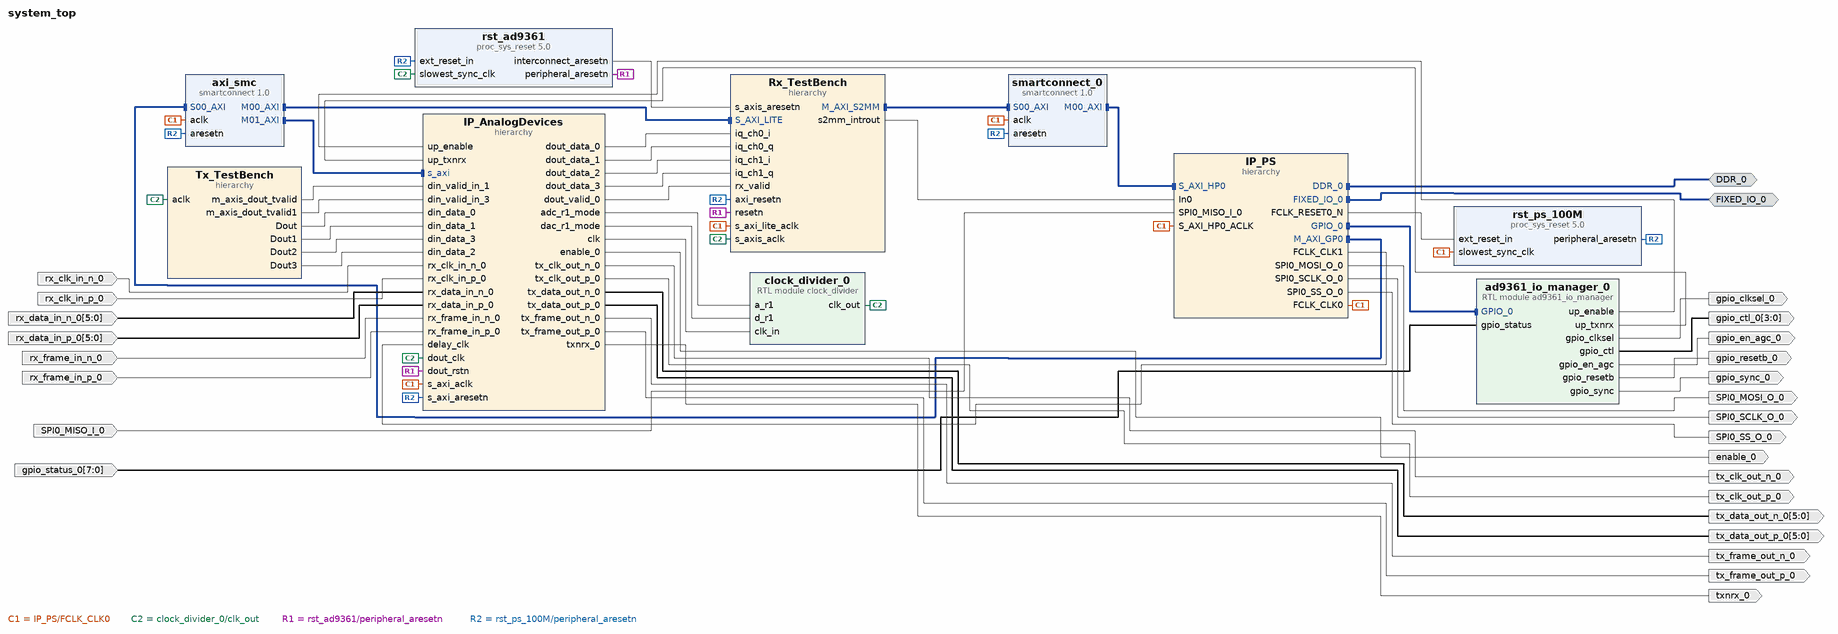
[diagram p0: block diagram of the top level]
# Vivado block design system_top, xc7z035ifbg676-2L, Vivado 2022.2
create_bd_design system_top

create_bd_intf_port -mode Master -vlnv xilinx.com:interface:ddrx_rtl:1.0 DDR_0
create_bd_intf_port -mode Master -vlnv xilinx.com:display_processing_system7:fixedio_rtl:1.0 FIXED_IO_0
create_bd_port -dir I SPI0_MISO_I_0
create_bd_port -dir O SPI0_MOSI_O_0
create_bd_port -dir O SPI0_SCLK_O_0
create_bd_port -dir O SPI0_SS_O_0
create_bd_port -dir O enable_0
create_bd_port -dir O gpio_clksel_0
create_bd_port -dir O -from 3 -to 0 gpio_ctl_0
create_bd_port -dir O gpio_en_agc_0
create_bd_port -dir O gpio_resetb_0
create_bd_port -dir I -from 7 -to 0 gpio_status_0
create_bd_port -dir O gpio_sync_0
create_bd_port -dir I rx_clk_in_n_0
create_bd_port -dir I rx_clk_in_p_0
create_bd_port -dir I -from 5 -to 0 rx_data_in_n_0
create_bd_port -dir I -from 5 -to 0 rx_data_in_p_0
create_bd_port -dir I rx_frame_in_n_0
create_bd_port -dir I rx_frame_in_p_0
create_bd_port -dir O tx_clk_out_n_0
create_bd_port -dir O tx_clk_out_p_0
create_bd_port -dir O -from 5 -to 0 tx_data_out_n_0
create_bd_port -dir O -from 5 -to 0 tx_data_out_p_0
create_bd_port -dir O tx_frame_out_n_0
create_bd_port -dir O tx_frame_out_p_0
create_bd_port -dir O txnrx_0

create_bd_cell -type hier IP_AnalogDevices
create_bd_cell -type hier IP_PS
create_bd_cell -type hier Rx_TestBench
create_bd_cell -type hier Tx_TestBench
create_bd_cell -type module -reference ad9361_io_manager ad9361_io_manager_0
create_bd_cell -type ip -vlnv xilinx.com:ip:smartconnect:1.0 axi_smc
set_property -dict {CONFIG.NUM_MI 2 CONFIG.NUM_SI 1} [get_bd_cells axi_smc]
create_bd_cell -type module -reference clock_divider clock_divider_0
create_bd_cell -type ip -vlnv xilinx.com:ip:proc_sys_reset:5.0 rst_ad9361
create_bd_cell -type ip -vlnv xilinx.com:ip:proc_sys_reset:5.0 rst_ps_100M
create_bd_cell -type ip -vlnv xilinx.com:ip:smartconnect:1.0 smartconnect_0
set_property -dict {CONFIG.NUM_CLKS 1 CONFIG.NUM_SI 1} [get_bd_cells smartconnect_0]

# ---- hierarchy /IP_AnalogDevices ----
current_bd_instance /IP_AnalogDevices
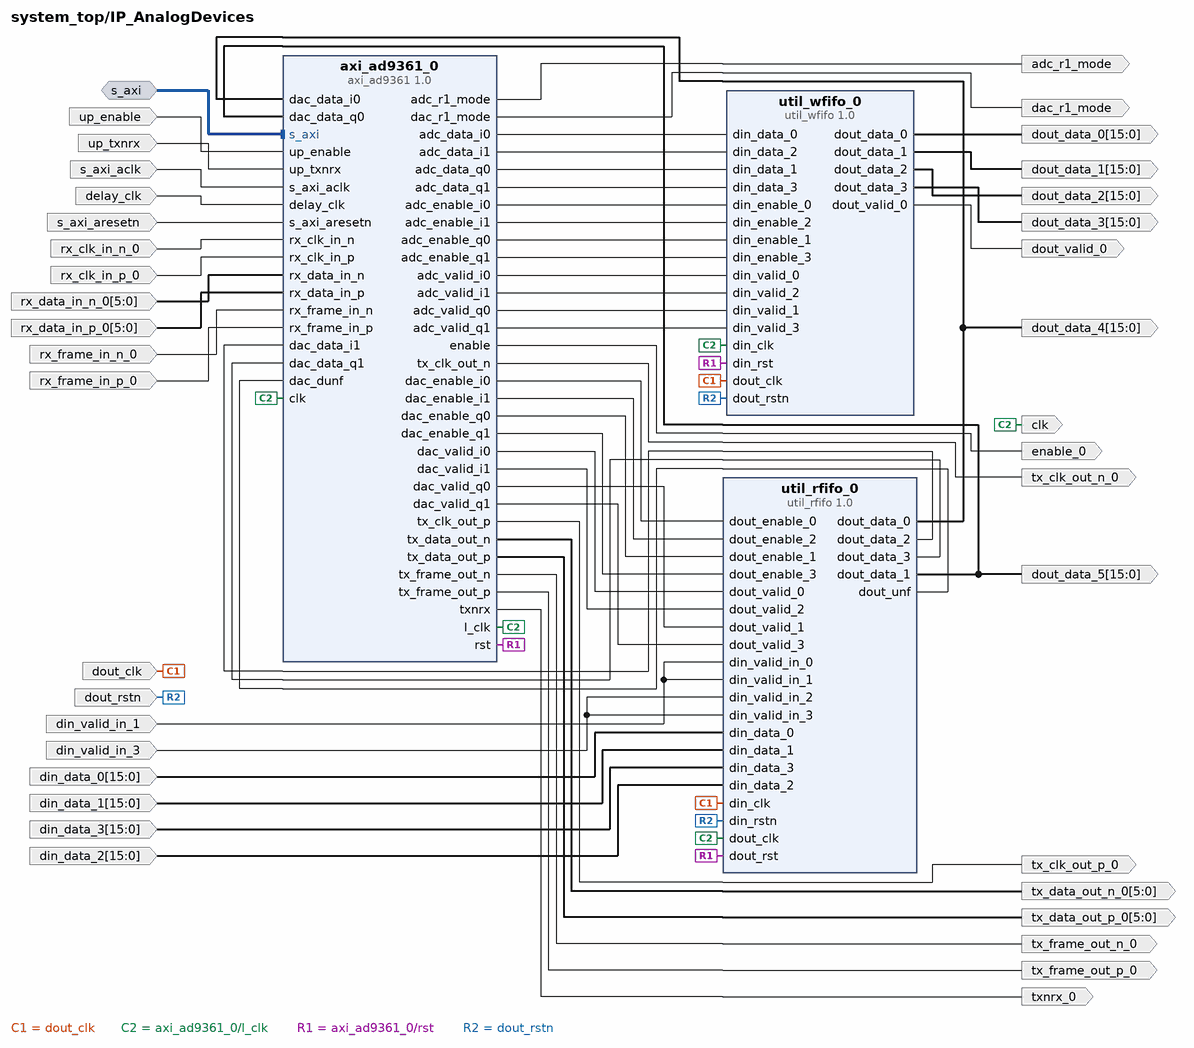
[diagram p1: block diagram inside /IP_AnalogDevices]
create_bd_intf_pin -mode Slave -vlnv xilinx.com:interface:aximm_rtl:1.0 s_axi
create_bd_pin -dir O adc_r1_mode
create_bd_pin -dir O -type clk clk
create_bd_pin -dir O dac_r1_mode
create_bd_pin -dir I -type clk delay_clk
create_bd_pin -dir I -from 15 -to 0 din_data_0
create_bd_pin -dir I -from 15 -to 0 din_data_1
create_bd_pin -dir I -from 15 -to 0 din_data_2
create_bd_pin -dir I -from 15 -to 0 din_data_3
create_bd_pin -dir I din_valid_in_1
create_bd_pin -dir I din_valid_in_3
create_bd_pin -dir I -type clk dout_clk
create_bd_pin -dir O -from 15 -to 0 dout_data_0
create_bd_pin -dir O -from 15 -to 0 dout_data_1
create_bd_pin -dir O -from 15 -to 0 dout_data_2
create_bd_pin -dir O -from 15 -to 0 dout_data_3
create_bd_pin -dir O -from 15 -to 0 dout_data_4
create_bd_pin -dir O -from 15 -to 0 dout_data_5
create_bd_pin -dir I -type rst dout_rstn
create_bd_pin -dir O dout_valid_0
create_bd_pin -dir O enable_0
create_bd_pin -dir I rx_clk_in_n_0
create_bd_pin -dir I rx_clk_in_p_0
create_bd_pin -dir I -from 5 -to 0 rx_data_in_n_0
create_bd_pin -dir I -from 5 -to 0 rx_data_in_p_0
create_bd_pin -dir I rx_frame_in_n_0
create_bd_pin -dir I rx_frame_in_p_0
create_bd_pin -dir I -type clk s_axi_aclk
create_bd_pin -dir I -type rst s_axi_aresetn
create_bd_pin -dir O tx_clk_out_n_0
create_bd_pin -dir O tx_clk_out_p_0
create_bd_pin -dir O -from 5 -to 0 tx_data_out_n_0
create_bd_pin -dir O -from 5 -to 0 tx_data_out_p_0
create_bd_pin -dir O tx_frame_out_n_0
create_bd_pin -dir O tx_frame_out_p_0
create_bd_pin -dir O txnrx_0
create_bd_pin -dir I up_enable
create_bd_pin -dir I up_txnrx

create_bd_cell -type ip -vlnv analog.com:user:axi_ad9361:1.0 axi_ad9361_0
set_property -dict [list \
  CONFIG.ADC_INIT_DELAY 29 \
  CONFIG.DAC_IODELAY_ENABLE 1 \
  CONFIG.DELAY_REFCLK_FREQUENCY 200 \
  CONFIG.TDD_DISABLE 1 \
] [get_bd_cells axi_ad9361_0]
create_bd_cell -type ip -vlnv analog.com:user:util_rfifo:1.0 util_rfifo_0
set_property -dict {CONFIG.DIN_DATA_WIDTH 16 CONFIG.DOUT_DATA_WIDTH 16} [get_bd_cells util_rfifo_0]
create_bd_cell -type ip -vlnv analog.com:user:util_wfifo:1.0 util_wfifo_0
set_property -dict {CONFIG.DIN_DATA_WIDTH 16 CONFIG.DOUT_DATA_WIDTH 16} [get_bd_cells util_wfifo_0]

# ---- hierarchy /IP_PS ----
current_bd_instance /IP_PS
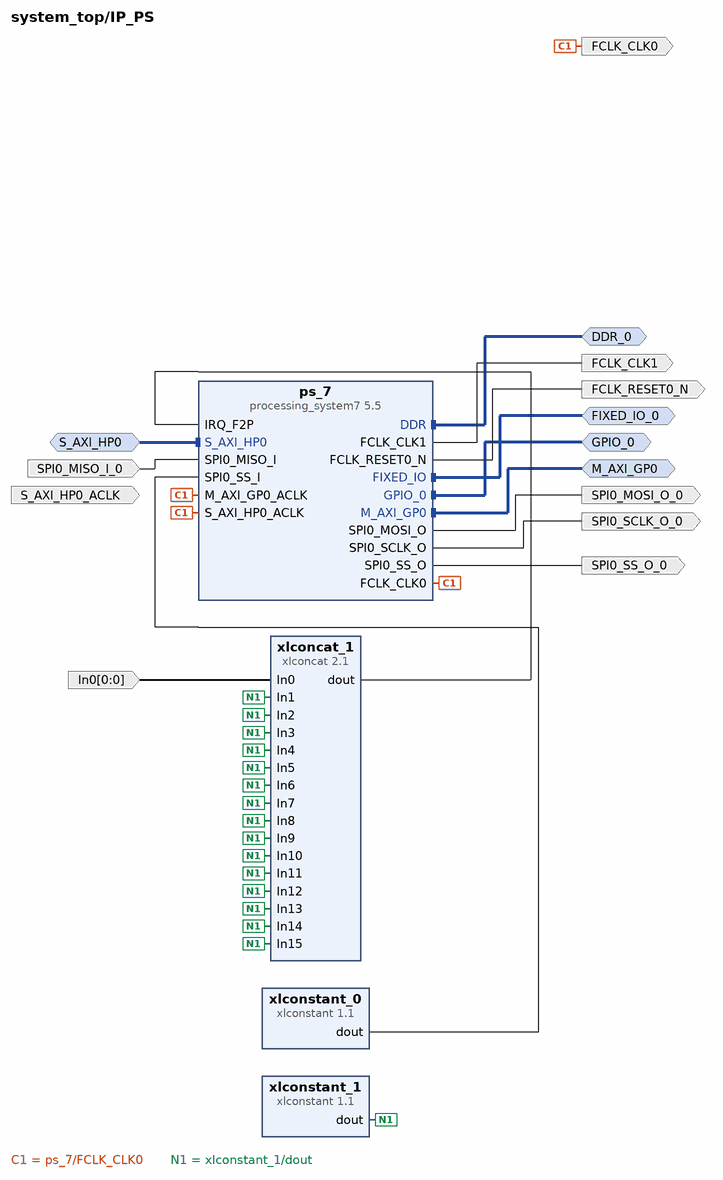
[diagram p2: block diagram inside /IP_PS]
create_bd_intf_pin -mode Master -vlnv xilinx.com:interface:ddrx_rtl:1.0 DDR_0
create_bd_intf_pin -mode Master -vlnv xilinx.com:display_processing_system7:fixedio_rtl:1.0 FIXED_IO_0
create_bd_intf_pin -mode Master -vlnv xilinx.com:interface:gpio_rtl:1.0 GPIO_0
create_bd_intf_pin -mode Master -vlnv xilinx.com:interface:aximm_rtl:1.0 M_AXI_GP0
create_bd_intf_pin -mode Slave -vlnv xilinx.com:interface:aximm_rtl:1.0 S_AXI_HP0
create_bd_pin -dir O -type clk FCLK_CLK0
create_bd_pin -dir O -type clk FCLK_CLK1
create_bd_pin -dir O -type rst FCLK_RESET0_N
create_bd_pin -dir I -from 0 -to 0 In0
create_bd_pin -dir I SPI0_MISO_I_0
create_bd_pin -dir O SPI0_MOSI_O_0
create_bd_pin -dir O SPI0_SCLK_O_0
create_bd_pin -dir O SPI0_SS_O_0
create_bd_pin -dir I -type clk S_AXI_HP0_ACLK

create_bd_cell -type ip -vlnv xilinx.com:ip:processing_system7:5.5 ps_7
set_property -dict [list \
  CONFIG.PCW_APU_PERIPHERAL_FREQMHZ 666.666666 \
  CONFIG.PCW_CPU_CPU_6X4X_MAX_RANGE 800 \
  CONFIG.PCW_ENET0_ENET0_IO {MIO 16 .. 27} \
  CONFIG.PCW_ENET0_GRP_MDIO_ENABLE 1 \
  CONFIG.PCW_ENET0_GRP_MDIO_IO {MIO 52 .. 53} \
  CONFIG.PCW_ENET0_PERIPHERAL_ENABLE 1 \
  CONFIG.PCW_ENET0_RESET_ENABLE 1 \
  CONFIG.PCW_ENET0_RESET_IO {MIO 8} \
  CONFIG.PCW_ENET_RESET_ENABLE 1 \
  CONFIG.PCW_ENET_RESET_SELECT {Share reset pin} \
  CONFIG.PCW_EN_CLK1_PORT 1 \
  CONFIG.PCW_FCLK_CLK0_BUF FALSE \
  CONFIG.PCW_FCLK_CLK1_BUF TRUE \
  CONFIG.PCW_FPGA0_PERIPHERAL_FREQMHZ 100 \
  CONFIG.PCW_FPGA1_PERIPHERAL_FREQMHZ 200 \
  CONFIG.PCW_FPGA_FCLK1_ENABLE 1 \
  CONFIG.PCW_GPIO_EMIO_GPIO_ENABLE 1 \
  CONFIG.PCW_GPIO_EMIO_GPIO_IO 64 \
  CONFIG.PCW_GPIO_MIO_GPIO_ENABLE 1 \
  CONFIG.PCW_GPIO_MIO_GPIO_IO MIO \
  CONFIG.PCW_I2C_RESET_ENABLE 0 \
  CONFIG.PCW_IRQ_F2P_INTR 1 \
  CONFIG.PCW_PERIPHERAL_BOARD_PRESET None \
  CONFIG.PCW_PRESET_BANK0_VOLTAGE {LVCMOS 1.8V} \
  CONFIG.PCW_PRESET_BANK1_VOLTAGE {LVCMOS 1.8V} \
  CONFIG.PCW_QSPI_GRP_SINGLE_SS_ENABLE 1 \
  CONFIG.PCW_QSPI_GRP_SINGLE_SS_IO {MIO 1 .. 6} \
  CONFIG.PCW_QSPI_PERIPHERAL_ENABLE 1 \
  CONFIG.PCW_QSPI_QSPI_IO {MIO 1 .. 6} \
  CONFIG.PCW_SD0_GRP_CD_ENABLE 0 \
  CONFIG.PCW_SD0_GRP_POW_ENABLE 1 \
  CONFIG.PCW_SD0_GRP_POW_IO {MIO 0} \
  CONFIG.PCW_SD0_GRP_WP_ENABLE 1 \
  CONFIG.PCW_SD0_GRP_WP_IO {MIO 50} \
  CONFIG.PCW_SD0_PERIPHERAL_ENABLE 1 \
  CONFIG.PCW_SD0_SD0_IO {MIO 40 .. 45} \
  CONFIG.PCW_SDIO_PERIPHERAL_FREQMHZ 100 \
  CONFIG.PCW_SINGLE_QSPI_DATA_MODE x4 \
  CONFIG.PCW_SPI0_PERIPHERAL_ENABLE 1 \
  CONFIG.PCW_SPI0_SPI0_IO EMIO \
  CONFIG.PCW_UART1_PERIPHERAL_ENABLE 1 \
  CONFIG.PCW_UART1_UART1_IO {MIO 48 .. 49} \
  CONFIG.PCW_UART_PERIPHERAL_FREQMHZ 100 \
  CONFIG.PCW_UIPARAM_DDR_FREQ_MHZ 533.333333 \
  CONFIG.PCW_UIPARAM_DDR_PARTNO {MT41K256M16 RE-125} \
  CONFIG.PCW_USB0_PERIPHERAL_ENABLE 0 \
  CONFIG.PCW_USB_RESET_ENABLE 0 \
  CONFIG.PCW_USE_FABRIC_INTERRUPT 1 \
  CONFIG.PCW_USE_S_AXI_HP0 1 \
] [get_bd_cells ps_7]
# 506 more settings of ps_7 are not shown: defaults, MIO pin electricals, DDR timing, and values the tool derives
create_bd_cell -type ip -vlnv xilinx.com:ip:xlconcat:2.1 xlconcat_1
set_property -dict {CONFIG.IN0_WIDTH 1 CONFIG.NUM_PORTS 16} [get_bd_cells xlconcat_1]
create_bd_cell -type ip -vlnv xilinx.com:ip:xlconstant:1.1 xlconstant_0
create_bd_cell -type ip -vlnv xilinx.com:ip:xlconstant:1.1 xlconstant_1
set_property -dict {CONFIG.CONST_VAL 0} [get_bd_cells xlconstant_1]

# ---- hierarchy /Rx_TestBench ----
current_bd_instance /Rx_TestBench
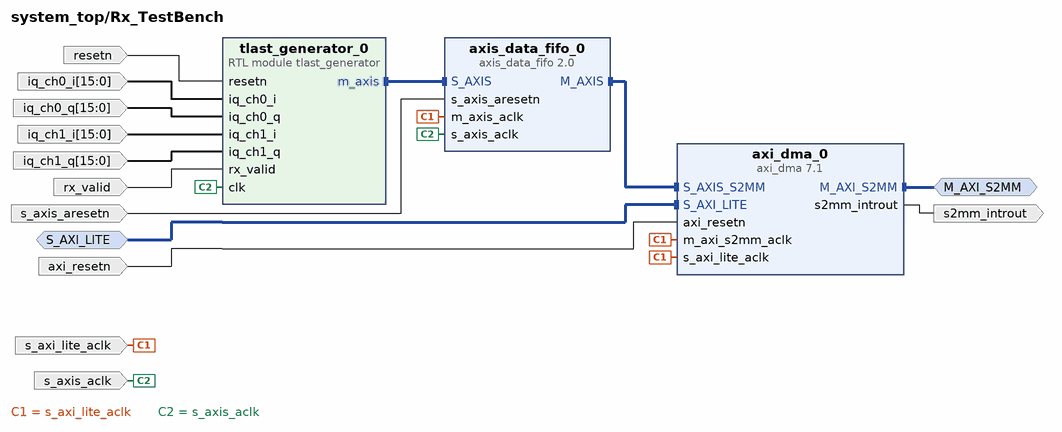
[diagram p3: block diagram inside /Rx_TestBench]
create_bd_intf_pin -mode Master -vlnv xilinx.com:interface:aximm_rtl:1.0 M_AXI_S2MM
create_bd_intf_pin -mode Slave -vlnv xilinx.com:interface:aximm_rtl:1.0 S_AXI_LITE
create_bd_pin -dir I -type rst axi_resetn
create_bd_pin -dir I -from 15 -to 0 iq_ch0_i
create_bd_pin -dir I -from 15 -to 0 iq_ch0_q
create_bd_pin -dir I -from 15 -to 0 iq_ch1_i
create_bd_pin -dir I -from 15 -to 0 iq_ch1_q
create_bd_pin -dir I -type rst resetn
create_bd_pin -dir I rx_valid
create_bd_pin -dir O -type intr s2mm_introut
create_bd_pin -dir I -type clk s_axi_lite_aclk
create_bd_pin -dir I -type clk s_axis_aclk
create_bd_pin -dir I -type rst s_axis_aresetn

create_bd_cell -type ip -vlnv xilinx.com:ip:axi_dma:7.1 axi_dma_0
set_property -dict [list \
  CONFIG.c_include_mm2s 0 \
  CONFIG.c_include_s2mm_dre 0 \
  CONFIG.c_include_sg 0 \
  CONFIG.c_s2mm_burst_size 64 \
] [get_bd_cells axi_dma_0]
create_bd_cell -type ip -vlnv xilinx.com:ip:axis_data_fifo:2.0 axis_data_fifo_0
set_property -dict {CONFIG.FIFO_DEPTH 1024 CONFIG.IS_ACLK_ASYNC 1} [get_bd_cells axis_data_fifo_0]
create_bd_cell -type module -reference tlast_generator tlast_generator_0
set_property -dict {CONFIG.PACKET_LENGTH 1024} [get_bd_cells tlast_generator_0]

# ---- hierarchy /Tx_TestBench ----
current_bd_instance /Tx_TestBench
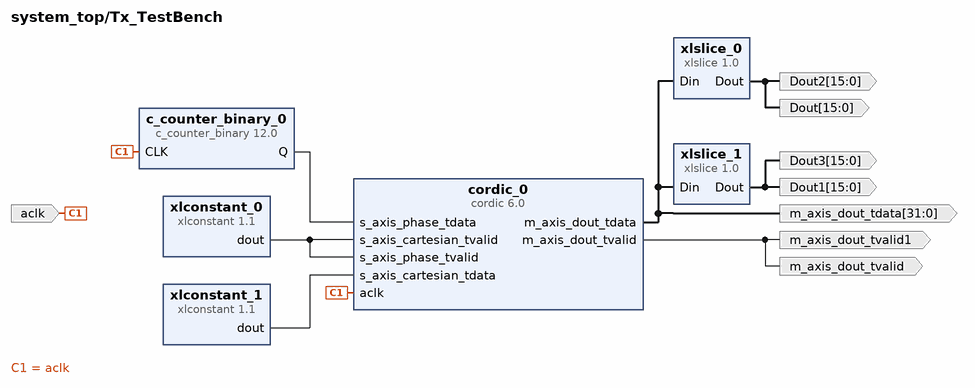
[diagram p4: block diagram inside /Tx_TestBench]
create_bd_pin -dir O -from 15 -to 0 Dout
create_bd_pin -dir O -from 15 -to 0 Dout1
create_bd_pin -dir O -from 15 -to 0 Dout2
create_bd_pin -dir O -from 15 -to 0 Dout3
create_bd_pin -dir I -type clk aclk
create_bd_pin -dir O -from 31 -to 0 m_axis_dout_tdata
create_bd_pin -dir O m_axis_dout_tvalid
create_bd_pin -dir O m_axis_dout_tvalid1

create_bd_cell -type ip -vlnv xilinx.com:ip:c_counter_binary:12.0 c_counter_binary_0
set_property -dict {CONFIG.Increment_Value 128 CONFIG.Restrict_Count false} [get_bd_cells c_counter_binary_0]
create_bd_cell -type ip -vlnv xilinx.com:ip:cordic:6.0 cordic_0
set_property -dict [list \
  CONFIG.Compensation_Scaling No_Scale_Compensation \
  CONFIG.Data_Format SignedFraction \
  CONFIG.Functional_Selection Rotate \
  CONFIG.Input_Width 16 \
  CONFIG.Output_Width 16 \
  CONFIG.cartesian_has_tlast false \
  CONFIG.out_tlast_behv Null \
] [get_bd_cells cordic_0]
create_bd_cell -type ip -vlnv xilinx.com:ip:xlconstant:1.1 xlconstant_0
create_bd_cell -type ip -vlnv xilinx.com:ip:xlconstant:1.1 xlconstant_1
set_property -dict {CONFIG.CONST_VAL 4095 CONFIG.CONST_WIDTH 32} [get_bd_cells xlconstant_1]
create_bd_cell -type ip -vlnv xilinx.com:ip:xlslice:1.0 xlslice_0
set_property -dict {CONFIG.DIN_FROM 15 CONFIG.DOUT_WIDTH 16} [get_bd_cells xlslice_0]
create_bd_cell -type ip -vlnv xilinx.com:ip:xlslice:1.0 xlslice_1
set_property -dict {CONFIG.DIN_FROM 31 CONFIG.DIN_TO 16} [get_bd_cells xlslice_1]

# ---- connections ----

current_bd_instance /IP_AnalogDevices
connect_bd_intf_net -intf_net axi_smc_M01_AXI [get_bd_intf_pins s_axi] [get_bd_intf_pins axi_ad9361_0/s_axi]
connect_bd_net [get_bd_pins dout_clk] [get_bd_pins util_rfifo_0/din_clk] [get_bd_pins util_wfifo_0/dout_clk]
connect_bd_net -net ad9361_io_manager_0_up_enable [get_bd_pins up_enable] [get_bd_pins axi_ad9361_0/up_enable]
connect_bd_net -net ad9361_io_manager_0_up_txnrx [get_bd_pins up_txnrx] [get_bd_pins axi_ad9361_0/up_txnrx]
connect_bd_net [get_bd_pins axi_ad9361_0/adc_data_i0] [get_bd_pins util_wfifo_0/din_data_0]
connect_bd_net [get_bd_pins axi_ad9361_0/adc_data_i1] [get_bd_pins util_wfifo_0/din_data_2]
connect_bd_net [get_bd_pins axi_ad9361_0/adc_data_q0] [get_bd_pins util_wfifo_0/din_data_1]
connect_bd_net [get_bd_pins axi_ad9361_0/adc_data_q1] [get_bd_pins util_wfifo_0/din_data_3]
connect_bd_net [get_bd_pins axi_ad9361_0/adc_enable_i0] [get_bd_pins util_wfifo_0/din_enable_0]
connect_bd_net [get_bd_pins axi_ad9361_0/adc_enable_i1] [get_bd_pins util_wfifo_0/din_enable_2]
connect_bd_net [get_bd_pins axi_ad9361_0/adc_enable_q0] [get_bd_pins util_wfifo_0/din_enable_1]
connect_bd_net [get_bd_pins axi_ad9361_0/adc_enable_q1] [get_bd_pins util_wfifo_0/din_enable_3]
connect_bd_net [get_bd_pins axi_ad9361_0/adc_r1_mode] [get_bd_pins adc_r1_mode]
connect_bd_net [get_bd_pins axi_ad9361_0/adc_valid_i0] [get_bd_pins util_wfifo_0/din_valid_0]
connect_bd_net [get_bd_pins axi_ad9361_0/adc_valid_i1] [get_bd_pins util_wfifo_0/din_valid_2]
connect_bd_net [get_bd_pins axi_ad9361_0/adc_valid_q0] [get_bd_pins util_wfifo_0/din_valid_1]
connect_bd_net [get_bd_pins axi_ad9361_0/adc_valid_q1] [get_bd_pins util_wfifo_0/din_valid_3]
connect_bd_net [get_bd_pins axi_ad9361_0/dac_enable_i0] [get_bd_pins util_rfifo_0/dout_enable_0]
connect_bd_net [get_bd_pins axi_ad9361_0/dac_enable_i1] [get_bd_pins util_rfifo_0/dout_enable_2]
connect_bd_net [get_bd_pins axi_ad9361_0/dac_enable_q0] [get_bd_pins util_rfifo_0/dout_enable_1]
connect_bd_net [get_bd_pins axi_ad9361_0/dac_enable_q1] [get_bd_pins util_rfifo_0/dout_enable_3]
connect_bd_net [get_bd_pins axi_ad9361_0/dac_r1_mode] [get_bd_pins dac_r1_mode]
connect_bd_net [get_bd_pins axi_ad9361_0/dac_valid_i0] [get_bd_pins util_rfifo_0/dout_valid_0]
connect_bd_net [get_bd_pins axi_ad9361_0/dac_valid_i1] [get_bd_pins util_rfifo_0/dout_valid_2]
connect_bd_net [get_bd_pins axi_ad9361_0/dac_valid_q0] [get_bd_pins util_rfifo_0/dout_valid_1]
connect_bd_net [get_bd_pins axi_ad9361_0/dac_valid_q1] [get_bd_pins util_rfifo_0/dout_valid_3]
connect_bd_net [get_bd_pins axi_ad9361_0/enable] [get_bd_pins enable_0]
connect_bd_net [get_bd_pins axi_ad9361_0/l_clk] \
  [get_bd_pins clk] [get_bd_pins axi_ad9361_0/clk] [get_bd_pins util_rfifo_0/dout_clk] [get_bd_pins util_wfifo_0/din_clk]
connect_bd_net [get_bd_pins axi_ad9361_0/rst] [get_bd_pins util_rfifo_0/dout_rst] [get_bd_pins util_wfifo_0/din_rst]
connect_bd_net [get_bd_pins axi_ad9361_0/tx_clk_out_n] [get_bd_pins tx_clk_out_n_0]
connect_bd_net [get_bd_pins axi_ad9361_0/tx_clk_out_p] [get_bd_pins tx_clk_out_p_0]
connect_bd_net [get_bd_pins axi_ad9361_0/tx_data_out_n] [get_bd_pins tx_data_out_n_0]
connect_bd_net [get_bd_pins axi_ad9361_0/tx_data_out_p] [get_bd_pins tx_data_out_p_0]
connect_bd_net [get_bd_pins axi_ad9361_0/tx_frame_out_n] [get_bd_pins tx_frame_out_n_0]
connect_bd_net [get_bd_pins axi_ad9361_0/tx_frame_out_p] [get_bd_pins tx_frame_out_p_0]
connect_bd_net [get_bd_pins axi_ad9361_0/txnrx] [get_bd_pins txnrx_0]
connect_bd_net -net cordic_0_m_axis_dout_tvalid [get_bd_pins din_valid_in_1] \
  [get_bd_pins util_rfifo_0/din_valid_in_0] [get_bd_pins util_rfifo_0/din_valid_in_1]
connect_bd_net -net cordic_1_m_axis_dout_tvalid [get_bd_pins din_valid_in_3] \
  [get_bd_pins util_rfifo_0/din_valid_in_2] [get_bd_pins util_rfifo_0/din_valid_in_3]
connect_bd_net -net microblaze_0_Clk [get_bd_pins s_axi_aclk] [get_bd_pins axi_ad9361_0/s_axi_aclk]
connect_bd_net -net proc_sys_reset_0_peripheral_aresetn [get_bd_pins dout_rstn] \
  [get_bd_pins util_rfifo_0/din_rstn] [get_bd_pins util_wfifo_0/dout_rstn]
connect_bd_net -net ps_7_FCLK_CLK1 [get_bd_pins delay_clk] [get_bd_pins axi_ad9361_0/delay_clk]
connect_bd_net -net rst_ps_7_50M_peripheral_aresetn [get_bd_pins s_axi_aresetn] [get_bd_pins axi_ad9361_0/s_axi_aresetn]
connect_bd_net -net rx_clk_in_n_0_1 [get_bd_pins rx_clk_in_n_0] [get_bd_pins axi_ad9361_0/rx_clk_in_n]
connect_bd_net -net rx_clk_in_p_0_1 [get_bd_pins rx_clk_in_p_0] [get_bd_pins axi_ad9361_0/rx_clk_in_p]
connect_bd_net -net rx_data_in_n_0_1 [get_bd_pins rx_data_in_n_0] [get_bd_pins axi_ad9361_0/rx_data_in_n]
connect_bd_net -net rx_data_in_p_0_1 [get_bd_pins rx_data_in_p_0] [get_bd_pins axi_ad9361_0/rx_data_in_p]
connect_bd_net -net rx_frame_in_n_0_1 [get_bd_pins rx_frame_in_n_0] [get_bd_pins axi_ad9361_0/rx_frame_in_n]
connect_bd_net -net rx_frame_in_p_0_1 [get_bd_pins rx_frame_in_p_0] [get_bd_pins axi_ad9361_0/rx_frame_in_p]
connect_bd_net [get_bd_pins util_rfifo_0/dout_data_0] [get_bd_pins dout_data_4] [get_bd_pins axi_ad9361_0/dac_data_i0]
connect_bd_net [get_bd_pins util_rfifo_0/dout_data_1] [get_bd_pins dout_data_5] [get_bd_pins axi_ad9361_0/dac_data_q0]
connect_bd_net [get_bd_pins util_rfifo_0/dout_data_2] [get_bd_pins axi_ad9361_0/dac_data_i1]
connect_bd_net [get_bd_pins util_rfifo_0/dout_data_3] [get_bd_pins axi_ad9361_0/dac_data_q1]
connect_bd_net [get_bd_pins util_rfifo_0/dout_unf] [get_bd_pins axi_ad9361_0/dac_dunf]
connect_bd_net [get_bd_pins util_wfifo_0/dout_data_0] [get_bd_pins dout_data_0]
connect_bd_net [get_bd_pins util_wfifo_0/dout_data_1] [get_bd_pins dout_data_1]
connect_bd_net [get_bd_pins util_wfifo_0/dout_data_2] [get_bd_pins dout_data_2]
connect_bd_net [get_bd_pins util_wfifo_0/dout_data_3] [get_bd_pins dout_data_3]
connect_bd_net [get_bd_pins util_wfifo_0/dout_valid_0] [get_bd_pins dout_valid_0]
connect_bd_net -net xlslice_0_Dout [get_bd_pins din_data_0] [get_bd_pins util_rfifo_0/din_data_0]
connect_bd_net -net xlslice_1_Dout [get_bd_pins din_data_1] [get_bd_pins util_rfifo_0/din_data_1]
connect_bd_net -net xlslice_2_Dout [get_bd_pins din_data_3] [get_bd_pins util_rfifo_0/din_data_3]
connect_bd_net -net xlslice_3_Dout [get_bd_pins din_data_2] [get_bd_pins util_rfifo_0/din_data_2]

current_bd_instance /IP_PS
connect_bd_intf_net [get_bd_intf_pins DDR_0] [get_bd_intf_pins ps_7/DDR]
connect_bd_intf_net [get_bd_intf_pins FIXED_IO_0] [get_bd_intf_pins ps_7/FIXED_IO]
connect_bd_intf_net [get_bd_intf_pins GPIO_0] [get_bd_intf_pins ps_7/GPIO_0]
connect_bd_intf_net [get_bd_intf_pins M_AXI_GP0] [get_bd_intf_pins ps_7/M_AXI_GP0]
connect_bd_intf_net -intf_net smartconnect_0_M00_AXI [get_bd_intf_pins S_AXI_HP0] [get_bd_intf_pins ps_7/S_AXI_HP0]
connect_bd_net -net SPI0_MISO_I_0_1 [get_bd_pins SPI0_MISO_I_0] [get_bd_pins ps_7/SPI0_MISO_I]
connect_bd_net -net axi_dma_0_s2mm_introut [get_bd_pins In0] [get_bd_pins xlconcat_1/In0]
connect_bd_net -net microblaze_0_Clk [get_bd_pins ps_7/FCLK_CLK0] \
  [get_bd_pins FCLK_CLK0] [get_bd_pins ps_7/M_AXI_GP0_ACLK] [get_bd_pins ps_7/S_AXI_HP0_ACLK]
connect_bd_net [get_bd_pins ps_7/FCLK_CLK1] [get_bd_pins FCLK_CLK1]
connect_bd_net [get_bd_pins ps_7/FCLK_RESET0_N] [get_bd_pins FCLK_RESET0_N]
connect_bd_net [get_bd_pins ps_7/SPI0_MOSI_O] [get_bd_pins SPI0_MOSI_O_0]
connect_bd_net [get_bd_pins ps_7/SPI0_SCLK_O] [get_bd_pins SPI0_SCLK_O_0]
connect_bd_net [get_bd_pins ps_7/SPI0_SS_O] [get_bd_pins SPI0_SS_O_0]
connect_bd_net [get_bd_pins xlconcat_1/dout] [get_bd_pins ps_7/IRQ_F2P]
connect_bd_net [get_bd_pins xlconstant_0/dout] [get_bd_pins ps_7/SPI0_SS_I]
connect_bd_net [get_bd_pins xlconstant_1/dout] \
  [get_bd_pins xlconcat_1/In1] [get_bd_pins xlconcat_1/In2] [get_bd_pins xlconcat_1/In3] [get_bd_pins xlconcat_1/In4] \
  [get_bd_pins xlconcat_1/In5] [get_bd_pins xlconcat_1/In6] [get_bd_pins xlconcat_1/In7] [get_bd_pins xlconcat_1/In8] \
  [get_bd_pins xlconcat_1/In9] [get_bd_pins xlconcat_1/In10] [get_bd_pins xlconcat_1/In11] [get_bd_pins xlconcat_1/In12] \
  [get_bd_pins xlconcat_1/In13] [get_bd_pins xlconcat_1/In14] [get_bd_pins xlconcat_1/In15]

current_bd_instance /Rx_TestBench
connect_bd_intf_net [get_bd_intf_pins M_AXI_S2MM] [get_bd_intf_pins axi_dma_0/M_AXI_S2MM]
connect_bd_intf_net -intf_net axi_smc_M00_AXI [get_bd_intf_pins S_AXI_LITE] [get_bd_intf_pins axi_dma_0/S_AXI_LITE]
connect_bd_intf_net [get_bd_intf_pins axi_dma_0/S_AXIS_S2MM] [get_bd_intf_pins axis_data_fifo_0/M_AXIS]
connect_bd_intf_net -intf_net custom_pack_0_m_axis [get_bd_intf_pins axis_data_fifo_0/S_AXIS] [get_bd_intf_pins tlast_generator_0/m_axis]
connect_bd_net -net F_clk0 [get_bd_pins s_axi_lite_aclk] \
  [get_bd_pins axi_dma_0/m_axi_s2mm_aclk] [get_bd_pins axi_dma_0/s_axi_lite_aclk] [get_bd_pins axis_data_fifo_0/m_axis_aclk]
connect_bd_net [get_bd_pins s_axis_aclk] [get_bd_pins axis_data_fifo_0/s_axis_aclk] [get_bd_pins tlast_generator_0/clk]
connect_bd_net [get_bd_pins axi_dma_0/s2mm_introut] [get_bd_pins s2mm_introut]
connect_bd_net -net proc_sys_reset_0_interconnect_aresetn [get_bd_pins s_axis_aresetn] [get_bd_pins axis_data_fifo_0/s_axis_aresetn]
connect_bd_net -net proc_sys_reset_0_peripheral_aresetn [get_bd_pins resetn] [get_bd_pins tlast_generator_0/resetn]
connect_bd_net -net rst_ps_7_50M_peripheral_aresetn [get_bd_pins axi_resetn] [get_bd_pins axi_dma_0/axi_resetn]
connect_bd_net -net util_wfifo_0_dout_data_0 [get_bd_pins iq_ch0_i] [get_bd_pins tlast_generator_0/iq_ch0_i]
connect_bd_net -net util_wfifo_0_dout_data_1 [get_bd_pins iq_ch0_q] [get_bd_pins tlast_generator_0/iq_ch0_q]
connect_bd_net -net util_wfifo_0_dout_data_2 [get_bd_pins iq_ch1_i] [get_bd_pins tlast_generator_0/iq_ch1_i]
connect_bd_net -net util_wfifo_0_dout_data_3 [get_bd_pins iq_ch1_q] [get_bd_pins tlast_generator_0/iq_ch1_q]
connect_bd_net -net util_wfifo_0_dout_valid_0 [get_bd_pins rx_valid] [get_bd_pins tlast_generator_0/rx_valid]

current_bd_instance /Tx_TestBench
connect_bd_net [get_bd_pins aclk] [get_bd_pins c_counter_binary_0/CLK] [get_bd_pins cordic_0/aclk]
connect_bd_net [get_bd_pins c_counter_binary_0/Q] [get_bd_pins cordic_0/s_axis_phase_tdata]
connect_bd_net [get_bd_pins cordic_0/m_axis_dout_tdata] [get_bd_pins m_axis_dout_tdata] [get_bd_pins xlslice_0/Din] [get_bd_pins xlslice_1/Din]
connect_bd_net [get_bd_pins cordic_0/m_axis_dout_tvalid] [get_bd_pins m_axis_dout_tvalid1] [get_bd_pins m_axis_dout_tvalid]
connect_bd_net [get_bd_pins xlconstant_0/dout] [get_bd_pins cordic_0/s_axis_cartesian_tvalid] [get_bd_pins cordic_0/s_axis_phase_tvalid]
connect_bd_net [get_bd_pins xlconstant_1/dout] [get_bd_pins cordic_0/s_axis_cartesian_tdata]
connect_bd_net [get_bd_pins xlslice_0/Dout] [get_bd_pins Dout2] [get_bd_pins Dout]
connect_bd_net [get_bd_pins xlslice_1/Dout] [get_bd_pins Dout3] [get_bd_pins Dout1]

current_bd_instance /
connect_bd_intf_net -intf_net axi_dma_0_M_AXI_S2MM [get_bd_intf_pins Rx_TestBench/M_AXI_S2MM] [get_bd_intf_pins smartconnect_0/S00_AXI]
connect_bd_intf_net [get_bd_intf_pins Rx_TestBench/S_AXI_LITE] [get_bd_intf_pins axi_smc/M00_AXI]
connect_bd_intf_net [get_bd_intf_pins IP_AnalogDevices/s_axi] [get_bd_intf_pins axi_smc/M01_AXI]
connect_bd_intf_net -intf_net ps_7_DDR [get_bd_intf_ports DDR_0] [get_bd_intf_pins IP_PS/DDR_0]
connect_bd_intf_net -intf_net ps_7_FIXED_IO [get_bd_intf_ports FIXED_IO_0] [get_bd_intf_pins IP_PS/FIXED_IO_0]
connect_bd_intf_net -intf_net ps_7_GPIO_0 [get_bd_intf_pins IP_PS/GPIO_0] [get_bd_intf_pins ad9361_io_manager_0/GPIO_0]
connect_bd_intf_net -intf_net ps_7_M_AXI_GP0 [get_bd_intf_pins IP_PS/M_AXI_GP0] [get_bd_intf_pins axi_smc/S00_AXI]
connect_bd_intf_net [get_bd_intf_pins IP_PS/S_AXI_HP0] [get_bd_intf_pins smartconnect_0/M00_AXI]
connect_bd_net -net F_clk0 [get_bd_pins IP_PS/FCLK_CLK0] \
  [get_bd_pins IP_AnalogDevices/s_axi_aclk] [get_bd_pins IP_PS/S_AXI_HP0_ACLK] [get_bd_pins Rx_TestBench/s_axi_lite_aclk] \
  [get_bd_pins axi_smc/aclk] [get_bd_pins rst_ps_100M/slowest_sync_clk] [get_bd_pins smartconnect_0/aclk]
connect_bd_net [get_bd_pins IP_AnalogDevices/adc_r1_mode] [get_bd_pins clock_divider_0/a_r1]
connect_bd_net [get_bd_pins IP_AnalogDevices/dac_r1_mode] [get_bd_pins clock_divider_0/d_r1]
connect_bd_net [get_bd_pins clock_divider_0/clk_out] \
  [get_bd_pins IP_AnalogDevices/dout_clk] [get_bd_pins Rx_TestBench/s_axis_aclk] [get_bd_pins Tx_TestBench/aclk] \
  [get_bd_pins rst_ad9361/slowest_sync_clk]
connect_bd_net -net SPI0_MISO_I_0_1 [get_bd_ports SPI0_MISO_I_0] [get_bd_pins IP_PS/SPI0_MISO_I_0]
connect_bd_net [get_bd_pins ad9361_io_manager_0/gpio_clksel] [get_bd_ports gpio_clksel_0]
connect_bd_net [get_bd_pins ad9361_io_manager_0/gpio_ctl] [get_bd_ports gpio_ctl_0]
connect_bd_net [get_bd_pins ad9361_io_manager_0/gpio_en_agc] [get_bd_ports gpio_en_agc_0]
connect_bd_net [get_bd_pins ad9361_io_manager_0/gpio_resetb] [get_bd_ports gpio_resetb_0]
connect_bd_net [get_bd_pins ad9361_io_manager_0/gpio_sync] [get_bd_ports gpio_sync_0]
connect_bd_net [get_bd_pins ad9361_io_manager_0/up_enable] [get_bd_pins IP_AnalogDevices/up_enable]
connect_bd_net [get_bd_pins ad9361_io_manager_0/up_txnrx] [get_bd_pins IP_AnalogDevices/up_txnrx]
connect_bd_net -net axi_ad9361_0_enable [get_bd_pins IP_AnalogDevices/enable_0] [get_bd_ports enable_0]
connect_bd_net -net axi_ad9361_0_l_clk [get_bd_pins IP_AnalogDevices/clk] [get_bd_pins clock_divider_0/clk_in]
connect_bd_net -net axi_ad9361_0_tx_clk_out_n [get_bd_pins IP_AnalogDevices/tx_clk_out_n_0] [get_bd_ports tx_clk_out_n_0]
connect_bd_net -net axi_ad9361_0_tx_clk_out_p [get_bd_pins IP_AnalogDevices/tx_clk_out_p_0] [get_bd_ports tx_clk_out_p_0]
connect_bd_net -net axi_ad9361_0_tx_data_out_n [get_bd_pins IP_AnalogDevices/tx_data_out_n_0] [get_bd_ports tx_data_out_n_0]
connect_bd_net -net axi_ad9361_0_tx_data_out_p [get_bd_pins IP_AnalogDevices/tx_data_out_p_0] [get_bd_ports tx_data_out_p_0]
connect_bd_net -net axi_ad9361_0_tx_frame_out_n [get_bd_pins IP_AnalogDevices/tx_frame_out_n_0] [get_bd_ports tx_frame_out_n_0]
connect_bd_net -net axi_ad9361_0_tx_frame_out_p [get_bd_pins IP_AnalogDevices/tx_frame_out_p_0] [get_bd_ports tx_frame_out_p_0]
connect_bd_net -net axi_ad9361_0_txnrx [get_bd_pins IP_AnalogDevices/txnrx_0] [get_bd_ports txnrx_0]
connect_bd_net -net axi_dma_0_s2mm_introut [get_bd_pins Rx_TestBench/s2mm_introut] [get_bd_pins IP_PS/In0]
connect_bd_net -net cordic_0_m_axis_dout_tvalid [get_bd_pins Tx_TestBench/m_axis_dout_tvalid] [get_bd_pins IP_AnalogDevices/din_valid_in_1]
connect_bd_net -net cordic_1_m_axis_dout_tvalid [get_bd_pins Tx_TestBench/m_axis_dout_tvalid1] [get_bd_pins IP_AnalogDevices/din_valid_in_3]
connect_bd_net -net gpio_status_0_1 [get_bd_ports gpio_status_0] [get_bd_pins ad9361_io_manager_0/gpio_status]
connect_bd_net -net proc_sys_reset_0_interconnect_aresetn [get_bd_pins rst_ad9361/interconnect_aresetn] [get_bd_pins Rx_TestBench/s_axis_aresetn]
connect_bd_net -net proc_sys_reset_0_peripheral_aresetn [get_bd_pins rst_ad9361/peripheral_aresetn] \
  [get_bd_pins IP_AnalogDevices/dout_rstn] [get_bd_pins Rx_TestBench/resetn]
connect_bd_net -net ps_7_FCLK_CLK1 [get_bd_pins IP_PS/FCLK_CLK1] [get_bd_pins IP_AnalogDevices/delay_clk]
connect_bd_net -net ps_7_FCLK_RESET0_N [get_bd_pins IP_PS/FCLK_RESET0_N] [get_bd_pins rst_ps_100M/ext_reset_in]
connect_bd_net -net ps_7_SPI0_MOSI_O [get_bd_pins IP_PS/SPI0_MOSI_O_0] [get_bd_ports SPI0_MOSI_O_0]
connect_bd_net -net ps_7_SPI0_SCLK_O [get_bd_pins IP_PS/SPI0_SCLK_O_0] [get_bd_ports SPI0_SCLK_O_0]
connect_bd_net -net ps_7_SPI0_SS_O [get_bd_pins IP_PS/SPI0_SS_O_0] [get_bd_ports SPI0_SS_O_0]
connect_bd_net -net rst_ps_7_50M_peripheral_aresetn [get_bd_pins rst_ps_100M/peripheral_aresetn] \
  [get_bd_pins IP_AnalogDevices/s_axi_aresetn] [get_bd_pins Rx_TestBench/axi_resetn] [get_bd_pins axi_smc/aresetn] \
  [get_bd_pins rst_ad9361/ext_reset_in] [get_bd_pins smartconnect_0/aresetn]
connect_bd_net -net rx_clk_in_n_0_1 [get_bd_ports rx_clk_in_n_0] [get_bd_pins IP_AnalogDevices/rx_clk_in_n_0]
connect_bd_net -net rx_clk_in_p_0_1 [get_bd_ports rx_clk_in_p_0] [get_bd_pins IP_AnalogDevices/rx_clk_in_p_0]
connect_bd_net -net rx_data_in_n_0_1 [get_bd_ports rx_data_in_n_0] [get_bd_pins IP_AnalogDevices/rx_data_in_n_0]
connect_bd_net -net rx_data_in_p_0_1 [get_bd_ports rx_data_in_p_0] [get_bd_pins IP_AnalogDevices/rx_data_in_p_0]
connect_bd_net -net rx_frame_in_n_0_1 [get_bd_ports rx_frame_in_n_0] [get_bd_pins IP_AnalogDevices/rx_frame_in_n_0]
connect_bd_net -net rx_frame_in_p_0_1 [get_bd_ports rx_frame_in_p_0] [get_bd_pins IP_AnalogDevices/rx_frame_in_p_0]
connect_bd_net -net util_wfifo_0_dout_data_0 [get_bd_pins IP_AnalogDevices/dout_data_0] [get_bd_pins Rx_TestBench/iq_ch0_i]
connect_bd_net -net util_wfifo_0_dout_data_1 [get_bd_pins IP_AnalogDevices/dout_data_1] [get_bd_pins Rx_TestBench/iq_ch0_q]
connect_bd_net -net util_wfifo_0_dout_data_2 [get_bd_pins IP_AnalogDevices/dout_data_2] [get_bd_pins Rx_TestBench/iq_ch1_i]
connect_bd_net -net util_wfifo_0_dout_data_3 [get_bd_pins IP_AnalogDevices/dout_data_3] [get_bd_pins Rx_TestBench/iq_ch1_q]
connect_bd_net -net util_wfifo_0_dout_valid_0 [get_bd_pins IP_AnalogDevices/dout_valid_0] [get_bd_pins Rx_TestBench/rx_valid]
connect_bd_net -net xlslice_0_Dout [get_bd_pins Tx_TestBench/Dout] [get_bd_pins IP_AnalogDevices/din_data_0]
connect_bd_net -net xlslice_1_Dout [get_bd_pins Tx_TestBench/Dout1] [get_bd_pins IP_AnalogDevices/din_data_1]
connect_bd_net -net xlslice_2_Dout [get_bd_pins Tx_TestBench/Dout2] [get_bd_pins IP_AnalogDevices/din_data_3]
connect_bd_net -net xlslice_3_Dout [get_bd_pins Tx_TestBench/Dout3] [get_bd_pins IP_AnalogDevices/din_data_2]

# ---- address map ----
assign_bd_address -offset 0x40400000 -range 64K -target_address_space [get_bd_addr_spaces IP_PS/ps_7/Data] [get_bd_addr_segs Rx_TestBench/axi_dma_0/S_AXI_LITE/Reg]
assign_bd_address -offset 0x43C00000 -range 64K -target_address_space [get_bd_addr_spaces IP_PS/ps_7/Data] [get_bd_addr_segs IP_AnalogDevices/axi_ad9361_0/s_axi/axi_lite]
assign_bd_address -offset 0x00000000 -range 1G -target_address_space [get_bd_addr_spaces Rx_TestBench/axi_dma_0/Data_S2MM] [get_bd_addr_segs IP_PS/ps_7/S_AXI_HP0/HP0_DDR_LOWOCM]

validate_bd_design
save_bd_design
